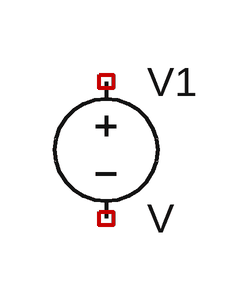
[diagram p0: schematic GateDriver.asc]
GateDriver.asc, the LTspice schematic file:
Version 4
SHEET 1 880 680
SYMBOL voltage 64 48 R0
SYMATTR InstName V1

The netlist it stands for:
* GateDriver.asc
V1 NC_01 NC_02 V
.backanno
.end